# EAGLE design WEMOS_ESP32_2S_V5 (EAGLE 9.6.2)
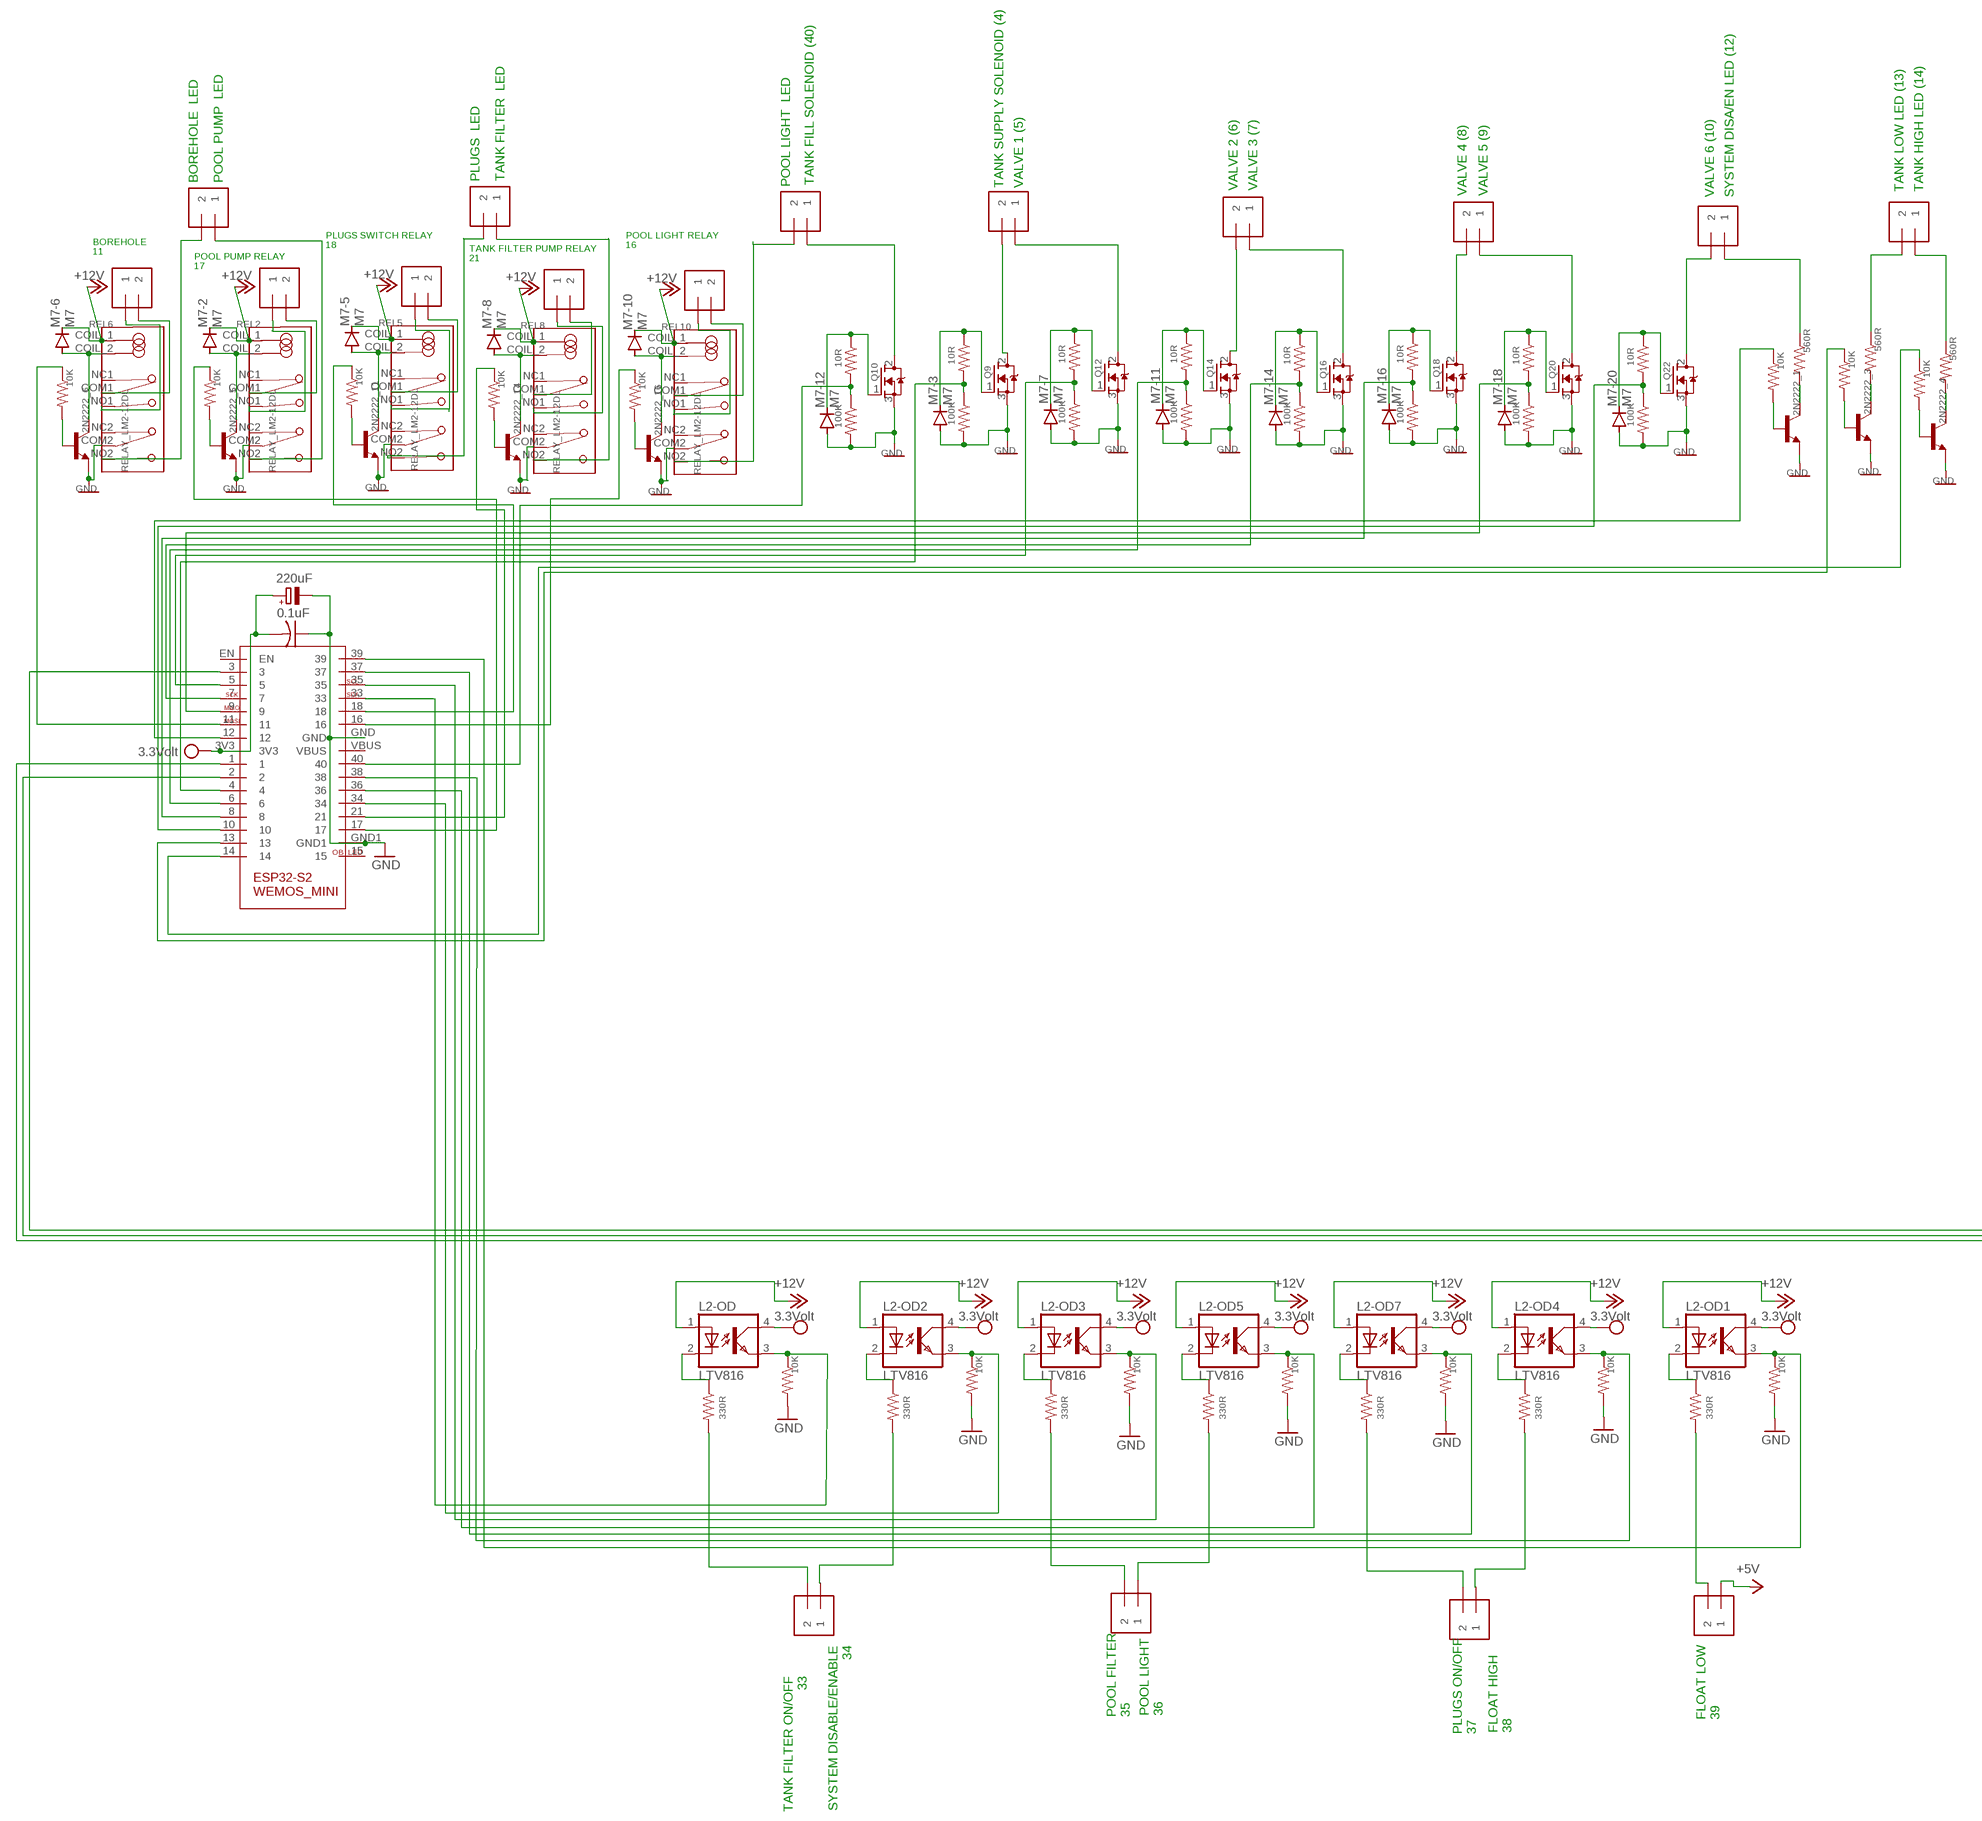
[diagram p0: schematic, sheet 1, part 1 of 2]
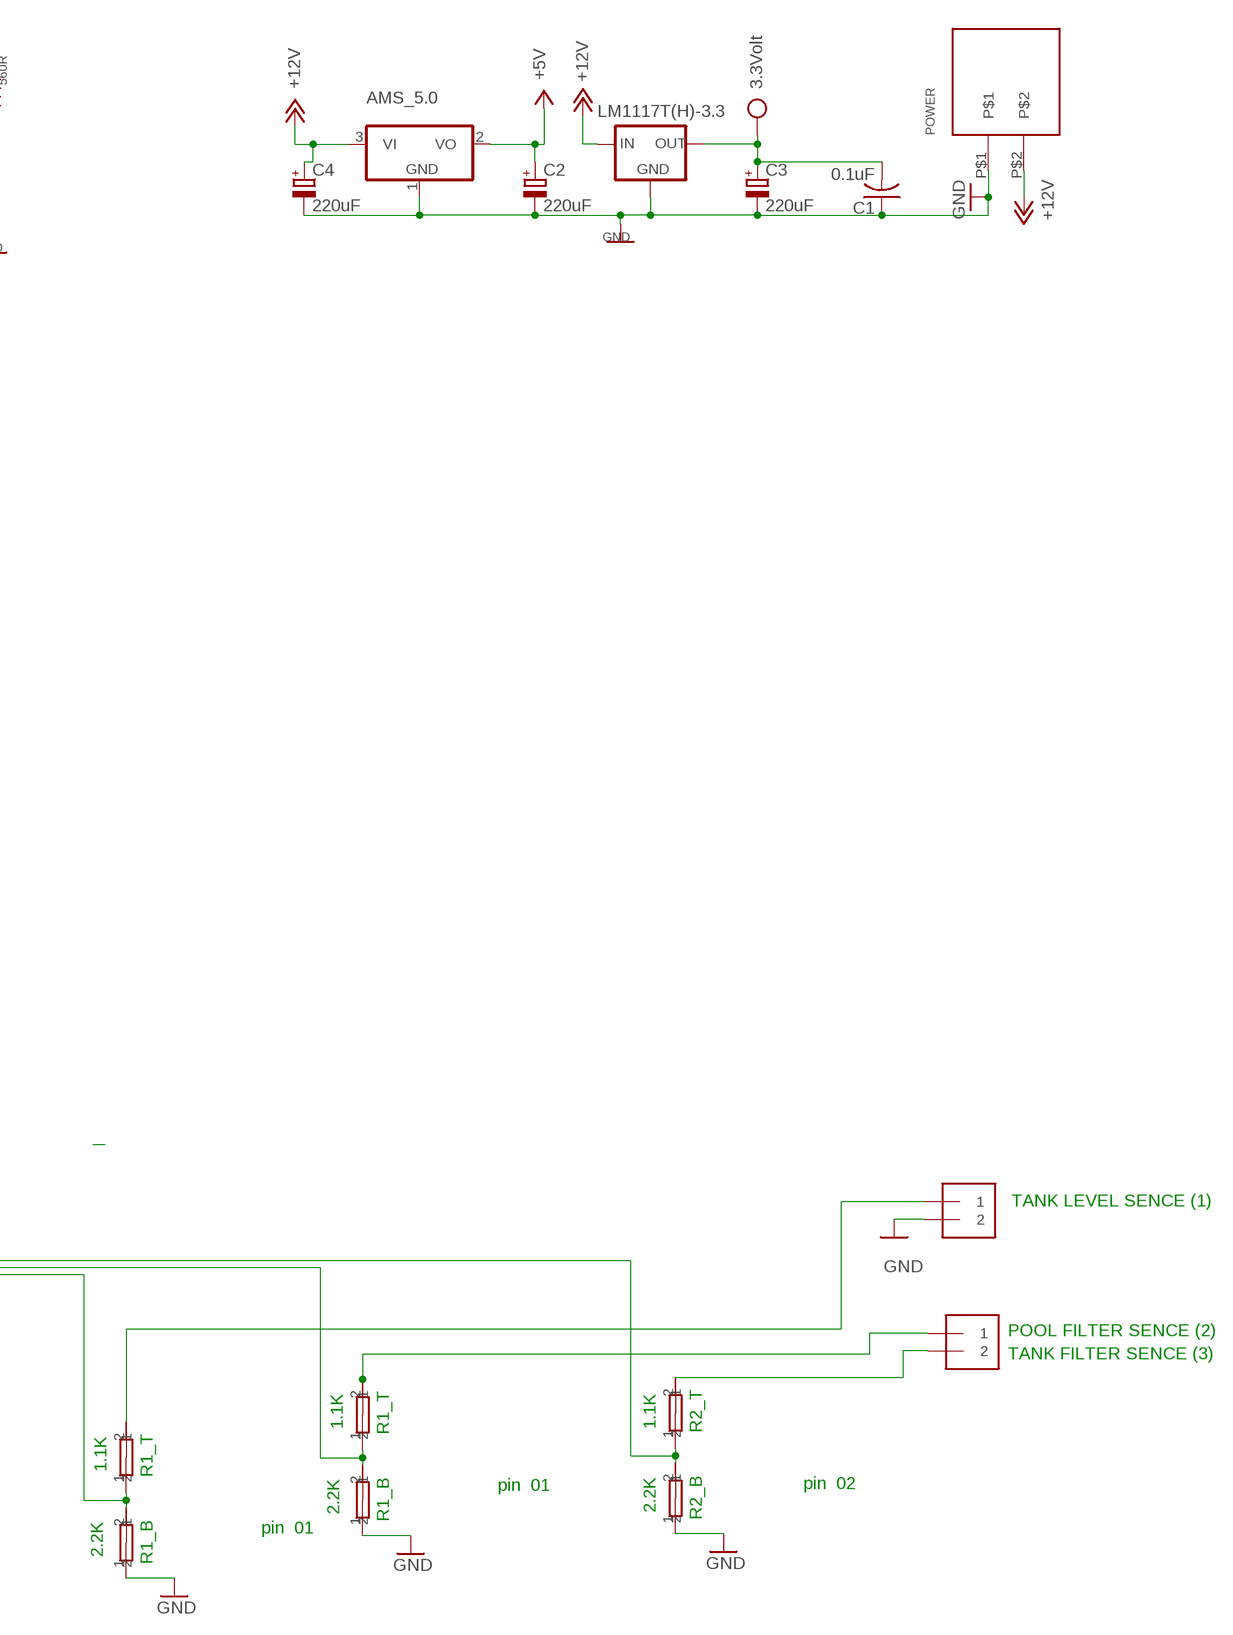
[diagram p1: schematic, sheet 1, part 2 of 2]

## Parts
2N2222_1  2N3904  [TO92]
2N2222_3  2N3904  [TO92]
2N2222_4  2N3904  [TO92]
2N2222_5  2N3904  [TO92]
2N2222_6  2N3904  [TO92]
2N2222_11  2N3904  [TO92]
2N2222_14  2N3904  [TO92]
2N2222_16  2N3904  [TO92]
12__1  FLOAT  TERMINNAL-3.5MM-2-3.5MMDOUBLE  [1X2-3.5MM]
12__2  FLOAT  TERMINNAL-3.5MM-2-3.5MMDOUBLE  [1X2-3.5MM]
12__3  FLOAT  TERMINNAL-3.5MM-2-3.5MMDOUBLE  [1X2-3.5MM]
12__4  FLOAT  TERMINNAL-3.5MM-2-3.5MMDOUBLE  [1X2-3.5MM]
12__5  FLOAT  TERMINNAL-3.5MM-2-3.5MMDOUBLE  [1X2-3.5MM]
12__6  FLOAT  TERMINNAL-3.5MM-2-3.5MMDOUBLE  [1X2-3.5MM]
12__7  FLOAT  TERMINNAL-3.5MM-2-3.5MMDOUBLE  [1X2-3.5MM]
12__13  FLOAT  TERMINNAL-3.5MM-2-3.5MMDOUBLE  [1X2-3.5MM]
18__1  FLOAT  TERMINNAL-3.5MM-2-3.5MMDOUBLE  [1X2-3.5MM]
18__2  FLOAT  TERMINNAL-3.5MM-2-3.5MMDOUBLE  [1X2-3.5MM]
+_33  AAA  TERMINNAL-3.5MM-2-3.5MMDOUBLE  [1X2-3.5MM]
+_35  TERMINNAL-3.5MM-2-3.5MMDOUBLE  [1X2-3.5MM]
+_37  TERMINNAL-3.5MM-2-3.5MMDOUBLE  [1X2-3.5MM]
+_39  TERMINNAL-3.5MM-2-3.5MMDOUBLE  [1X2-3.5MM]
AMS_5.0  AMS1117DB  [SOT223]
C1  0.1uF  C-US050-025X075  [C050-025X075]
C2  220uF  CPOL-EUE2.5-7  [E2,5-7]
C3  220uF  CPOL-EUE2.5-7  [E2,5-7]
C4  220uF  CPOL-EUE2.5-7  [E2,5-7]
C5  0.1uF  C-US050-025X075  [C050-025X075]
C6  220uF  CPOL-EUE2.5-7  [E2,5-7]
IC1  LM1117T(H)-3.3  [TO220H]
L2-OD  LTV816  [DIL04]
L2-OD1  LTV816  [DIL04]
L2-OD2  LTV816  [DIL04]
L2-OD3  LTV816  [DIL04]
L2-OD4  LTV816  [DIL04]
L2-OD5  LTV816  [DIL04]
L2-OD7  LTV816  [DIL04]
M7-2  M7  DIODE-SOD106-R  [SOD106-R]
M7-3  M7  DIODE-SOD106-R  [SOD106-R]
M7-5  M7  DIODE-SOD106-R  [SOD106-R]
M7-6  M7  DIODE-SOD106-R  [SOD106-R]
M7-7  M7  DIODE-SOD106-R  [SOD106-R]
M7-8  M7  DIODE-SOD106-R  [SOD106-R]
M7-10  M7  DIODE-SOD106-R  [SOD106-R]
M7-11  M7  DIODE-SOD106-R  [SOD106-R]
M7-12  M7  DIODE-SOD106-R  [SOD106-R]
M7-14  M7  DIODE-SOD106-R  [SOD106-R]
M7-16  M7  DIODE-SOD106-R  [SOD106-R]
M7-18  M7  DIODE-SOD106-R  [SOD106-R]
M7-20  M7  DIODE-SOD106-R  [SOD106-R]
POWER  TERMINAL-5.08MM-2BIG_HOLE  [TERM-5.05-2_BH]
Q9  IRF3205  MOSFET-NGDS_TO220V  [TO220V]
Q10  IRF3205  MOSFET-NGDS_TO220V  [TO220V]
Q12  IRF3205  MOSFET-NGDS_TO220V  [TO220V]
Q14  IRF3205  MOSFET-NGDS_TO220V  [TO220V]
Q16  IRF3205  MOSFET-NGDS_TO220V  [TO220V]
Q18  IRF3205  MOSFET-NGDS_TO220V  [TO220V]
Q20  IRF3205  MOSFET-NGDS_TO220V  [TO220V]
Q22  IRF3205  MOSFET-NGDS_TO220V  [TO220V]
R1  10K  R-US_R0805  [R0805]
R1_B  2.2K  RESISTOR  [0207/10]
R1_B1  2.2k  RESISTOR  [0207/10]
R1_B2  2.2K  RESISTOR  [0207/10]
R1_T  1.1K  RESISTOR  [0207/10]
R1_T1  1.1K  RESISTOR  [0207/10]
R2_T1  1.1K  RESISTOR  [0207/10]
R3  330R  R-US_R0805  [R0805]
R4  560R  R-US_R0805  [R0805]
R5  10K  R-US_R0805  [R0805]
R7  10K  R-US_R0805  [R0805]
R8  10R  R-US_R0805  [R0805]
R9  10K  R-US_R0805  [R0805]
R10  10K  R-US_R0805  [R0805]
R11  100K  R-US_R0805  [R0805]
R12  330R  R-US_R0805  [R0805]
R13  10K  R-US_R0805  [R0805]
R14  330R  R-US_R0805  [R0805]
R15  10K  R-US_R0805  [R0805]
R16  330R  R-US_R0805  [R0805]
R17  10K  R-US_R0805  [R0805]
R18  330R  R-US_R0805  [R0805]
R19  10K  R-US_R0805  [R0805]
R20  10K  R-US_R0805  [R0805]
R21  10K  R-US_R0805  [R0805]
R22  330R  R-US_R0805  [R0805]
R23  10K  R-US_R0805  [R0805]
R24  10K  R-US_R0805  [R0805]
R25  560R  R-US_R0805  [R0805]
R26  10R  R-US_R0805  [R0805]
R27  100K  R-US_R0805  [R0805]
R28  10K  R-US_R0805  [R0805]
R29  330R  R-US_R0805  [R0805]
R30  10K  R-US_R0805  [R0805]
R31  560R  R-US_R0805  [R0805]
R32  10R  R-US_R0805  [R0805]
R33  100K  R-US_R0805  [R0805]
R36  10R  R-US_R0805  [R0805]
R37  100K  R-US_R0805  [R0805]
R40  10R  R-US_R0805  [R0805]
R41  100K  R-US_R0805  [R0805]
R43  10R  R-US_R0805  [R0805]
R45  10R  R-US_R0805  [R0805]
R46  100K  R-US_R0805  [R0805]
R47  100K  R-US_R0805  [R0805]
R50  10R  R-US_R0805  [R0805]
R51  100K  R-US_R0805  [R0805]
REL2  RELAY_LM2-12DL  [RELAY4078]
REL5  RELAY_LM2-12DL  [RELAY4078]
REL6  RELAY_LM2-12DL  [RELAY4078]
REL8  RELAY_LM2-12DL  [RELAY4078]
REL10  RELAY_LM2-12DL  [RELAY4078]
U$1  WEMOS_S2_MINI  [WEMOS_S2_MINI]
XX1  FLOAT  TERMINNAL-3.5MM-2-3.5MMDOUBLE  [1X2-3.5MM]
XX3  FLOAT  TERMINNAL-3.5MM-2-3.5MMDOUBLE  [1X2-3.5MM]
XX6  FLOAT  TERMINNAL-3.5MM-2-3.5MMDOUBLE  [1X2-3.5MM]
XX8  FLOAT  TERMINNAL-3.5MM-2-3.5MMDOUBLE  [1X2-3.5MM]
XX10  FLOAT  TERMINNAL-3.5MM-2-3.5MMDOUBLE  [1X2-3.5MM]

## Nets
+5V [12V]: +_39.1 AMS_5.0.2(VO) C2.+
+12V [12V]: AMS_5.0.3(VI) C4.+ IC1.3(IN) L2-OD1.1(A) L2-OD2.1(A) L2-OD3.1(A) L2-OD4.1(A) L2-OD5.1(A) L2-OD7.1(A) L2-OD.1(A) M7-2.C M7-5.C M7-6.C M7-8.C M7-10.C POWER.P$2 REL2.COIL_1(COIL1) REL5.COIL_1(COIL1) REL6.COIL_1(COIL1) REL8.COIL_1(COIL1) REL10.COIL_1(COIL1)
GND [GND]: 2N2222_1.3(E) 2N2222_3.3(E) 2N2222_4.3(E) 2N2222_5.3(E) 2N2222_6.3(E) 2N2222_11.3(E) 2N2222_14.3(E) 2N2222_16.3(E) 18__1.2 AMS_5.0.1(GND) C1.1 C2.- C3.- C4.- C5.1 C6.- IC1.1(GND) M7-3.A M7-7.A M7-11.A M7-12.A M7-14.A M7-16.A M7-18.A M7-20.A POWER.P$1 Q9.3(S) Q10.3(S) Q12.3(S) Q14.3(S) Q16.3(S) Q18.3(S) Q20.3(S) Q22.3(S) R1_B1.1 R1_B2.1 R1_B.1 R7.2 R11.2 R13.2 R15.2 R17.2 R19.2 R23.2 R27.2 R30.2 R33.2 R37.2 R41.2 R46.2 R47.2 R51.2 REL2.COM2 REL5.COM2 REL6.COM2 REL8.COM2 REL10.COM2 U$1.GND U$1.GND1
N$1: R26.2 R27.1 U$1.5
N$2: 2N2222_6.2(B) R10.2
N$3: +_33.2 R3.2
N$4: R24.1 U$1.16
N$5: L2-OD.2(C) R3.1
N$6: R43.2 R46.1 U$1.40
N$7: 12__13.2 REL6.NO2
N$8: R5.1 U$1.17
N$9: M7-3.C Q9.1(G) R8.1
N$10: R1_B1.2 R2_T1.1 U$1.3
N$11: R8.2 R11.1 U$1.4
N$12: 2N2222_3.2(B) R21.2
N$13: 2N2222_5.1(C) M7-2.A REL2.COIL_2(COIL2)
N$14: 2N2222_1.1(C) R4.2
N$15: 2N2222_5.2(B) R5.2
N$16 [POWER]: REL2.COM1 XX3.2
N$17: R9.1 U$1.18
N$18: R20.1 U$1.21
N$19 [POWER]: REL2.NO1 XX3.1
N$20: L2-OD1.2(C) R29.1
N$21: +_39.2 R29.2
N$22: 2N2222_3.1(C) R25.2
N$23: M7-7.C Q12.1(G) R26.1
N$24: R10.1 U$1.11
N$25: R1_B.2 R1_T.1 U$1.2
N$26: 12__13.1 REL2.NO2
N$27: R40.2 R41.1 U$1.8
N$28: +_33.1 R12.2
N$29: 2N2222_4.2(B) R28.2
N$30: R21.1 U$1.13
N$31: 2N2222_1.2(B) R1.2
N$32: 2N2222_4.1(C) R31.2
N$33: R28.1 U$1.14
N$34: R36.2 R37.1 U$1.7
N$35: L2-OD7.3(EMIT) R23.1 U$1.37
N$36: M7-11.C Q14.1(G) R32.1
N$37: R32.2 R33.1 U$1.6
N$38: 18__1.1 R1_T1.2
N$39: R1.1 U$1.12
N$40 [POWER]: REL5.COM1 XX6.2
N$41: L2-OD2.3(EMIT) R13.1 U$1.34
N$42: L2-OD.3(EMIT) R7.1 U$1.33
N$43: 18__2.2 R2_T1.2
N$44: M7-14.C Q16.1(G) R36.1
N$45 [POWER]: REL5.NO1 XX6.1
N$46: L2-OD1.3(EMIT) R30.1 U$1.39
N$47: L2-OD2.2(C) R12.1
N$48 [POWER]: REL8.COM1 XX8.2
N$49 [POWER]: REL8.NO1 XX8.1
N$50 [POWER]: REL10.COM1 XX10.2
N$51 [POWER]: REL10.NO1 XX10.1
N$52: M7-16.C Q18.1(G) R40.1
N$53 [POWER]: REL6.COM1 XX1.2
N$54 [POWER]: REL6.NO1 XX1.1
N$55: +_35.2 R14.2
N$56: L2-OD5.3(EMIT) R19.1 U$1.36
N$57: 18__2.1 R1_T.2
N$58: L2-OD3.2(C) R14.1
N$60: +_35.1 R18.2
N$61: L2-OD3.3(EMIT) R15.1 U$1.35
N$62: 2N2222_6.1(C) M7-6.A REL6.COIL_2(COIL2)
N$65: +_37.2 R22.2
N$67: M7-18.C Q20.1(G) R45.1
N$69: L2-OD4.2(C) R16.1
N$71: +_37.1 R16.2
N$72: L2-OD4.3(EMIT) R17.1 U$1.38
N$73: R45.2 R47.1 U$1.9
N$74: L2-OD5.2(C) R18.1
N$76: 2N2222_11.1(C) M7-5.A REL5.COIL_2(COIL2)
N$77: 2N2222_11.2(B) R9.2
N$78: M7-12.C Q10.1(G) R43.1
N$81: 12__1.2 REL5.NO2
N$84: L2-OD7.2(C) R22.1
N$85: M7-20.C Q22.1(G) R50.1
N$86: R50.2 R51.1 U$1.10
N$87: 12__1.1 REL8.NO2
N$91: 12__2.2 REL10.NO2
N$92: 2N2222_14.1(C) M7-8.A REL8.COIL_2(COIL2)
N$93: 2N2222_14.2(B) R20.2
N$96 [POWER]: 12__2.1 Q10.2(D)
N$97: R1_B2.2 R1_T1.1 U$1.1
N$100 [POWER]: 12__3.2 Q9.2(D)
N$101 [POWER]: 12__3.1 Q12.2(D)
N$102 [POWER]: 12__4.2 Q14.2(D)
N$103: 2N2222_16.1(C) M7-10.A REL10.COIL_2(COIL2)
N$104: 2N2222_16.2(B) R24.2
N$107 [POWER]: 12__4.1 Q16.2(D)
N$108 [POWER]: 12__5.2 Q18.2(D)
N$109 [POWER]: 12__5.1 Q20.2(D)
N$110 [POWER]: 12__6.2 Q22.2(D)
N$111: 12__6.1 R4.1
N$112: 12__7.2 R25.1
N$113: 12__7.1 R31.1
VCC [3V]: C1.2 C3.+ C5.2 C6.+ IC1.2(OUT) L2-OD1.4(COL) L2-OD2.4(COL) L2-OD3.4(COL) L2-OD4.4(COL) L2-OD5.4(COL) L2-OD7.4(COL) L2-OD.4(COL) U$1.3V3
Unconnected: REL2.NC1 REL2.NC2 REL5.NC1 REL5.NC2 REL6.NC1 REL6.NC2 REL8.NC1 REL8.NC2 REL10.NC1 REL10.NC2 U$1.15 U$1.EN U$1.VBUS

## Notes on the sheet
- BOREHOLE  LED | POOL PUMP  LED | PLUGS  LED | TANK FILTER  LED
- POOL LIGHT  LED | TANK FILL SOLENOID (40) | TANK SUPPLY SOLENOID (4) | VALVE 1 (5)
- VALVE 2 (6) | VALVE 3 (7) | TANK LOW LED (13) | TANK HIGH LED (14)
- VALVE 4 (8) | VALVE 5 (9) | VALVE 6 (10) | SYSTEM DISA/EN LED (12)
- PLUGS SWITCH RELAY
  18
- POOL LIGHT RELAY
  16
- BOREHOLE
  11
- TANK FILTER PUMP RELAY
  21
- POOL PUMP RELAY
  17
- TANK LEVEL SENCE (1)
- POOL FILTER SENCE (2)
- TANK FILTER SENCE (3)
- 1.1K | 1.1K | R2_T
- R1_T
- 1.1K
- R1_T
- pin  01 | pin  02
- 2.2K | 2.2K
- R1_B | R2_B
- pin  01
- 2.2K
- R1_B
- SYSTEM DISABLE/ENABLE
  34
- TANK FILTER ON/OFF
  33
- POOL LIGHT
  36
- POOL FILTER
  35
- FLOAT LOW
  39
- FLOAT HIGH
  38
- PLUGS ON/OFF
  37

## Library data of the parts
2N2222_1 2N2222_3-2N2222_6 2N2222_11 2N2222_14 2N2222_16 = transistor:2N3904: NPN TRANSISTOR
12__1-12__7 12__13 18__1 18__2 +_33 +_35 +_37 +_39 XX1 XX3 XX6 XX8 XX10 = BDV_02:TERMINNAL-3.5MM-2: 3.5mm Terminal block http://www.ladyada.net/library/pcb/eaglelibrary.html
AMS_5.0 = BDV_01:AMS1117: 250 mA, 16V, Low Quiescent Current LDO Regulator Source: http://ww1.microchip.com/downloads/en/DeviceDoc/22049b.pdf
C1 C5 = adafruit:C-US: CAPACITOR, American symbol
C2-C4 C6 = resistor:CPOL-EU: POLARIZED CAPACITOR, European symbol
IC1 = lm1117_10:LM1117?-*: 800mA Low-Dropout Linear Regulator Source: http://www.ti.com/lit/ds/symlink/lm1117-n.pdf; MF: Texas Instruments; MPN: LM1117T-3.3; OC_FARNELL: 1469056; OC_NEWARK: 13B5347
L2-OD L2-OD1-L2-OD5 L2-OD7 = optocoupler:LTV816: OPTO COUPLER Source: LITEON, LTV816.pdf; OC_FARNELL: unknown; OC_NEWARK: unknown
M7-2 M7-3 M7-5-M7-8 M7-10-M7-12 M7-14 M7-16 M7-18 M7-20 = diode:DIODE-: DIODE
POWER = BDV_02:TERMINAL-5.08MM-2: Terminal 5.08mm - 2
Q9 Q10 Q12 Q14 Q16 Q18 Q20 Q22 = adafruit:MOSFET-N: N-Channel Mosfet 2N7002E - 60V 260mA SOT23 [Digikey: 2N7002ET1GOSTR-ND] - REEL BSH103 - 30V 850mA SOT23 [Digikey: 568-5013-1-ND]
R1 R3-R5 R7-R33 R36 R37 R40 R41 R43 R45-R47 R50 R51 = resistor:R-US_: RESISTOR, American symbol
R1_B R1_B1 R1_B2 R1_T R1_T1 R2_T1 = BDV_02:RESISTOR
REL2 REL5 REL6 REL8 REL10 = BDV_02:RELAY_LM2-12DL: Relay Small Symbol
U$1 = BDV_02:WEMOS_S2_MINI: WEMOS_MINI

## Net classes
0 default: width 0.305 mm, drill 0.305 mm, clearance 0.305 mm
1 POWER: width 0.889 mm, drill 0.508 mm, clearance 0.305 mm to class 0, clearance 0.508 mm
2 12V: width 0.889 mm, drill 0.508 mm, clearance 0.305 mm to class 0, clearance 0.508 mm
3 ground: width 0.889 mm, drill 0.508 mm, clearance 0.305 mm to class 0, clearance 0.305 mm to class 1, clearance 0.305 mm to class 2, clearance 0.305 mm
4 3V: width 0.635 mm, drill 0.508 mm, clearance 0.305 mm to class 0, clearance 0.508 mm
5 GND: width 0.889 mm, drill 0.508 mm, clearance 0.305 mm to class 0, clearance 0.508 mm

## Board
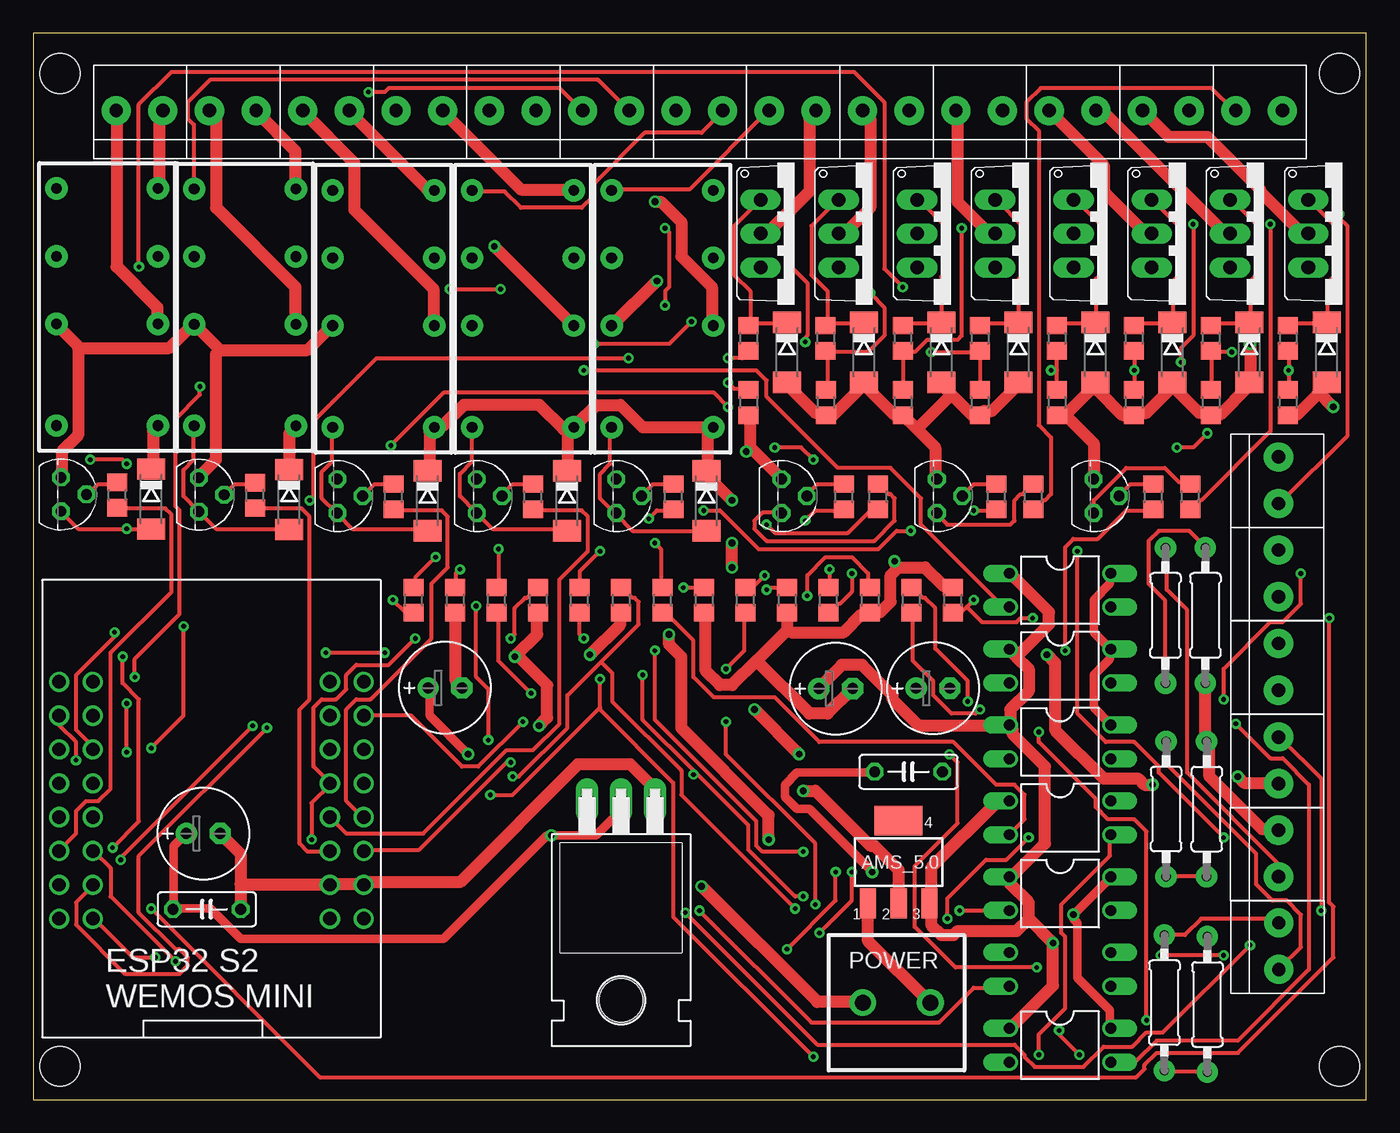
[diagram p2: board, top side]
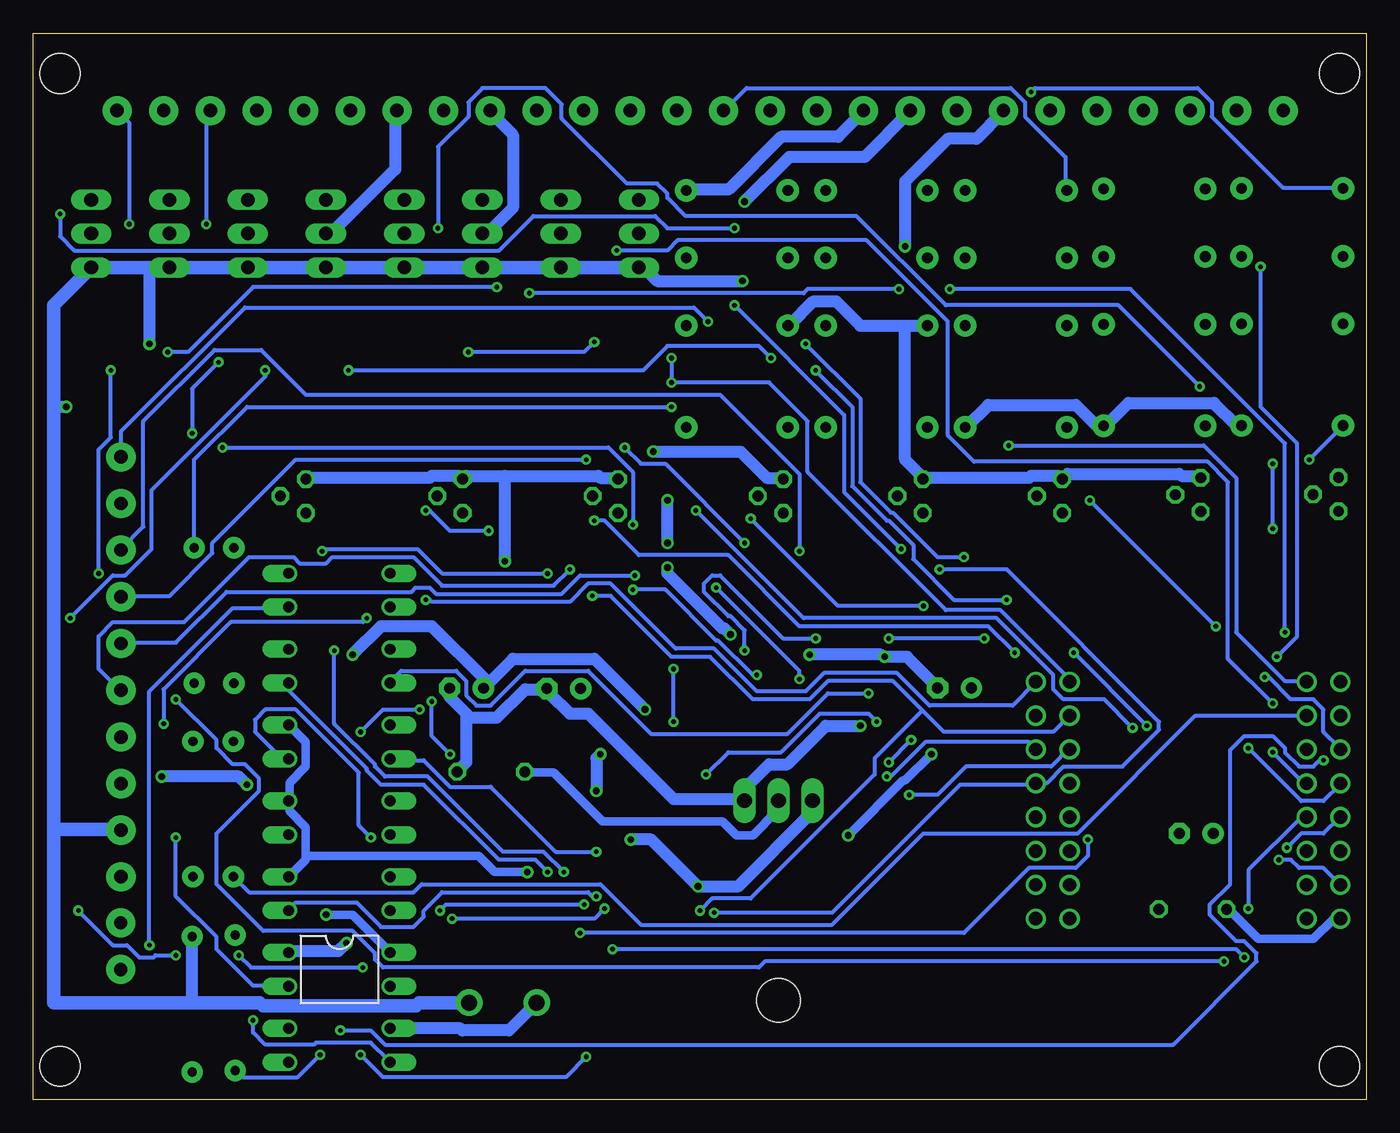
[diagram p3: board, bottom side, seen from below]

Size 100 x 80 mm. Coordinates in mm from the lower left corner, seen from the top.
Outline: 0,0 100,0 100,80 0,80 0,0
Copper layers (1*16): Top 0.035mm / dielectric 1.5mm / Bottom 0.035mm
Design rules "default *": minimum track width 6mil, minimum drill 0.35mm, track to track 6mil, track to pad 6mil, pad to pad 6mil, via to via 6mil, smd to smd 6mil, copper to edge 40mil, drill to drill 6mil, minimum pad ring 10mil, minimum via ring 8mil, stop-mask expansion 4mil, vias tented up to drill 20mil, thermal gap 10mil
Holes 3 mm at 2,77 2,2.5 98,2.5 98,77

### Footprints (pad centres in the part's own frame; a part is rotated, then mirrored left to right if it is on the bottom)
TO92 = drill 0.813 octagon: 1 1.27,0; 2 0,1.905; 3 -1.27,0
1X2-3.5MM = drill 1 pad 2.184: 1 1.8,0; 2 -1.7,0
SOT223 = smd 1.219 x 2.235: 1 -2.311,-3.099; 2 0,-3.099; 3 2.311,-3.099 | smd 3.6 x 2.2: 4 0,3.099
C050-025X075 = drill 0.813 octagon: 1 -2.54,0; 2 2.54,0
E2,5-7 = drill 0.813 pad 1.6: + -1.27,0 | drill 0.813 pad 1.6 octagon: - 1.27,0
TO220H = drill 1.118 long: 1 -2.54,-10.16; 2 0,-10.16; 3 2.54,-10.16 | hole 3.302: 0,4.826
DIL04 = drill 0.813 offset: 1 -1.27,-3.81; 2 1.27,-3.81; 3 1.27,3.81; 4 -1.27,3.81
SOD106-R = smd 1.6 x 2.1: A 2.25,0; C -2.25,0
TERM-5.05-2_BH = drill 1.2 pad 2: P$1 0,2.54; P$2 0,-2.54
TO220V = drill 1.016 long: 1 -2.54,-2.54; 2 0,-2.54; 3 2.54,-2.54
R0805 = smd 1.3 x 1.5: 1 -0.95,0; 2 0.95,0
0207/10 = drill 0.7 pad 1.6: 1 -5.08,0; 2 5.08,0
RELAY4078 = drill 0.8 pad 1.676: COIL_1 -3.81,8.89; COIL_2 3.81,8.89; COM1 -3.81,1.27; COM2 3.81,1.27; NC1 -3.81,-3.81; NC2 3.81,-3.81; NO1 -3.81,-8.89; NO2 3.81,-8.89
WEMOS_S2_MINI = drill 1: 1 -8.89,10.16; 2 -8.89,7.62; 3 -11.43,7.62; 3V3 -11.43,-7.62; 4 -8.89,5.08; 5 -11.43,5.08; 6 -8.89,2.54; 7 -11.43,2.54; 8 -8.89,0; 9 -11.43,0; 10 -8.89,-2.54; 11 -11.43,-2.54; 12 -11.43,-5.08; 13 -8.89,-5.08; 14 -8.89,-7.62; 15 8.89,-7.62; 16 11.43,-2.54; 17 8.89,-2.54; 18 11.43,0; 21 8.89,0; 33 11.43,2.54; 34 8.89,2.54; 35 11.43,5.08; 36 8.89,5.08; 37 11.43,7.62; 38 8.89,7.62; 39 11.43,10.16; 40 8.89,10.16; EN -11.43,10.16; GND 11.43,-5.08; GND1 8.89,-5.08; VBUS 11.43,-7.62

### Placement (x,y rotation side)
2N2222_1  56.13,45.28 270 top
2N2222_3  67.79,45.28 270 top
2N2222_4  79.55,45.28 270 top
2N2222_5  12.41,45.38 270 top
2N2222_6  2.08,45.41 270 top
2N2222_11  22.8,45.28 270 top
2N2222_14  33.27,45.28 270 top
2N2222_16  43.73,45.28 270 top
12__1  49.91,74.2 0 top
12__2  56.91,74.2 0 top
12__3  63.91,74.2 0 top
12__4  70.91,74.2 0 top
12__5  77.91,74.2 0 top
12__6  84.91,74.2 0 top
12__7  91.91,74.2 0 top
12__13  42.91,74.2 0 top
18__1  93.42,18.52 270 top
18__2  93.45,11.56 270 top
+_33  93.43,46.52 270 top
+_35  93.43,39.53 270 top
+_37  93.43,32.51 270 top
+_39  93.43,25.5 270 top
AMS_5.0  64.92,17.82 0 top
C1  65.66,24.59 180 top
C2  67.5,30.86 0 top
C3  30.89,30.89 0 top
C4  60.2,30.84 0 top
C5  13.02,14.27 180 top
C6  12.75,19.96 0 top
IC1  44.09,12.27 180 top
L2-OD  77.03,38.21 270 top
L2-OD1  77.03,4.06 270 top
L2-OD2  77.03,32.52 270 top
L2-OD3  77.03,26.83 270 top
L2-OD4  77.03,9.76 270 bottom
L2-OD5  77.03,21.14 270 top
L2-OD7  77.03,15.45 270 top
M7-2  19.18,45.02 270 top
M7-3  62.34,56.07 270 top
M7-5  29.57,44.92 270 top
M7-6  8.84,45.05 270 top
M7-7  68.12,56.07 270 top
M7-8  40.03,44.92 270 top
M7-10  50.5,44.92 270 top
M7-11  73.9,56.07 270 top
M7-12  56.55,56.07 270 top
M7-14  79.68,56.07 270 top
M7-16  85.46,56.07 270 top
M7-18  91.25,56.07 270 top
M7-20  97.03,56.07 270 top
POWER  64.77,7.26 270 top
Q9  62.97,64.97 270 top
Q10  57.1,64.97 270 top
Q12  68.84,64.97 270 top
Q14  74.71,64.97 270 top
Q16  80.58,64.97 270 top
Q18  86.45,64.97 270 top
Q20  92.33,64.97 270 top
Q22  98.2,64.97 270 top
R1  60.81,45.23 90 top
R1_B  88.04,21.79 270 top
R1_B1  88.09,7.14 270 top
R1_B2  87.93,36.32 90 top
R1_T  84.99,21.79 90 top
R1_T1  84.94,36.32 90 top
R2_T1  84.86,7.26 90 top
R3  28.55,37.46 90 top
R4  63.37,45.23 90 top
R5  16.64,45.33 90 top
R7  31.66,37.46 270 top
R8  59.44,57.12 270 top
R9  27.03,45.23 90 top
R10  6.3,45.35 90 top
R11  59.45,52.3 270 top
R12  34.77,37.46 90 top
R13  37.88,37.46 270 top
R14  40.99,37.46 90 top
R15  44.11,37.46 270 top
R16  59.67,37.46 90 top
R17  62.78,37.46 270 top
R18  47.22,37.46 90 top
R19  50.33,37.46 270 top
R20  37.49,45.23 90 top
R21  72.26,45.23 90 top
R22  53.44,37.46 90 top
R23  56.55,37.46 270 top
R24  48.03,45.23 90 top
R25  75.03,45.23 90 top
R26  65.23,57.12 270 top
R27  65.23,52.3 270 top
R28  84.02,45.23 90 top
R29  65.89,37.46 90 top
R30  69,37.46 90 top
R31  86.79,45.23 90 top
R32  71.01,57.12 270 top
R33  71.01,52.3 270 top
R36  76.79,57.12 270 top
R37  76.79,52.3 270 top
R40  82.57,57.12 270 top
R41  82.57,52.3 270 top
R43  53.66,57.12 270 top
R45  88.35,57.12 270 top
R46  53.67,52.3 270 top
R47  88.35,52.3 270 top
R50  94.14,57.12 270 top
R51  94.13,52.3 270 top
REL2  15.88,59.44 180 top
REL5  26.27,59.33 180 top
REL6  5.54,59.46 180 top
REL8  36.73,59.33 180 top
REL10  47.2,59.33 180 top
U$1  13.36,21.18 0 top
XX1  7.91,74.2 0 top
XX3  14.91,74.2 0 top
XX6  21.91,74.2 0 top
XX8  28.91,74.2 0 top
XX10  35.91,74.2 0 top

### Tracks (layer width: path | path; a pad name or v marks a point on that pad's centre or on a via)
+5V  (via drill 0.51)
  Top 0.889: AMS_5.0.2 64.92,17.22 63.09,19.05 62.79,19.05 58.67,23.16 v57.76,23.16 | v54.1,29.26 v57.45,25.91 | v90.37,24.23 90.83,23.77 93.42,23.77 +_39.1 | v83.97,23.62 83.36,23.62 82.91,24.08 80.31,24.08 76.66,27.74 76.66,32.77 v76.05,33.38
  Bottom 0.889: v57.76,23.16 57.76,25.6 v57.45,25.91 | v54.1,29.26 57.91,33.07 64.01,33.07 66.14,30.94 C2.+ 66.14,31.55 70.1,35.51 73.91,35.51 v76.05,33.38 | v90.37,24.23 84.58,24.23 v83.97,23.62
+12V  (via drill 0.51)
  Top 0.889: M7-6.C 8.99,47.4 8.99,50.14 9.3,50.44 REL6.COIL_1 | M7-2.C 19.2,47.4 19.2,49.99 19.66,50.44 REL2.COIL_1 | M7-5.C 29.72,47.24 29.72,50.14 30.02,50.44 REL5.COIL_1 30.48,50.6 30.79,50.6 32.31,52.12 37.95,52.12 39.78,50.29 REL8.COIL_1 | M7-8.C 40.08,47.24 40.08,49.99 REL8.COIL_1 | REL8.COIL_1 40.84,50.75 42.22,52.12 44.04,52.12 45.72,50.44 REL10.COIL_1 50.9,50.44 50.6,50.14 50.6,47.24 M7-10.C 50.6,46.79 v52.43,44.96 | 73.76,33.22 73.3,33.68 L2-OD2.1 | 73.76,33.22 74.68,32.31 74.68,30.63 73.3,29.26 73.3,28.19 L2-OD3.1 | 73.76,33.22 76.2,35.66 76.2,36.58 73.3,39.47 L2-OD.1 | C4.+ 58.98,30.94 60.66,32.61 62.18,32.61 64.47,30.33 64.47,30.02 66.45,28.04 72.85,28.04 L2-OD3.1 | L2-OD5.1 73.15,22.4 72.39,22.4 67.36,17.37 67.36,14.78 AMS_5.0.3 67.36,14.33 67.36,13.11 68.12,12.34 69.04,12.34 69.34,12.65 73.76,12.65 74.68,13.56 | 74.68,13.56 74.68,14.78 73.3,16.15 73.3,16.61 L2-OD7.1 73.61,16.92 75.89,19.2 75.89,24.99 73.46,27.43 73.46,27.74 L2-OD3.1 | 74.68,13.56 v76.5,11.73 76.5,8.53 73.3,5.33 L2-OD1.1 | v50.14,16 58.83,7.32 62.18,7.32 POWER.P$2 | v52.43,39.93 v52.43,41.76 | v47.7,34.9 47.7,34.14 48.62,33.22 48.62,27.89 55.17,21.34 v55.17,19.51
  Bottom 0.889: REL5.COIL_1 30.02,50.44 28.35,52.12 21.79,52.12 20.27,50.6 19.81,50.6 REL2.COIL_1 19.36,50.75 17.83,52.27 11.43,52.27 9.75,50.6 9.45,50.6 REL6.COIL_1 | v76.5,11.73 77.11,11.12 80.77,11.12 L2-OD4.1 | L2-OD1.1 67.97,5.33 67.82,5.18 64.31,5.18 POWER.P$2 | IC1.3 41.6,22.4 41.6,21.49 47.09,16 v50.14,16 53.65,19.51 v55.17,19.51 | v52.43,41.76 v52.43,44.96 | v52.43,39.93 52.43,39.47 48.31,35.36 48.16,35.36 v47.7,34.9
GND  (via drill 0.51)
  Top 0.889: 77.42,51.36 76.81,51.36 R37.2 | 77.42,51.36 79.55,53.49 79.55,53.8 M7-14.A 79.86,53.19 81.69,51.36 82.45,51.36 R41.2 82.91,51.51 83.52,51.51 85.19,53.19 M7-16.A 85.5,53.8 85.5,53.49 87.48,51.51 87.94,51.51 R47.2 88.39,51.36 89,51.36 91.14,53.49 91.14,53.8 M7-18.A 91.29,54.25 v91.29,56.69 | 2N2222_4.3 79.55,49.23 77.42,51.36 | 53.8,48.92 53.8,51.21 R46.2 | 53.8,48.92 56.08,46.63 2N2222_1.3 | v53.49,48.62 53.8,48.92 | 68.89,52.88 67.97,53.8 M7-7.A | 68.89,52.88 70.41,51.36 70.87,51.36 R33.2 71.32,51.66 71.93,51.66 73.76,53.49 73.76,53.8 M7-11.A | M7-12.A 56.69,53.8 56.69,53.49 58.67,51.51 59.13,51.51 R11.2 59.59,51.36 60.05,51.36 62.48,53.8 M7-3.A 62.64,53.34 64.62,51.36 R27.2 65.53,51.05 66.29,50.29 | 66.29,50.29 67.67,48.92 67.67,46.63 2N2222_3.3 | 66.29,50.29 68.89,52.88 | 56.54,35.2 54.25,32.92 | 54.25,32.92 52.43,31.09 51.51,31.09 50.44,32.16 50.44,36.42 R19.2 | 56.54,35.2 56.54,36.42 R23.2 | 56.54,35.2 56.84,35.05 60.81,35.05 62.18,36.42 62.64,36.42 R17.2 63.25,36.58 63.55,36.58 64.31,37.34 64.31,39.32 64.92,39.93 | 64.92,39.93 66.9,39.93 68.28,38.56 68.89,38.56 R30.2 | 15.54,16.15 15.54,18.44 C6.- | 15.54,16.15 15.54,14.33 C5.1 | 15.54,16.15 21.95,16.15 U$1.GND1 22.25,16.15 24.69,16.15 U$1.GND 25.15,16.31 32,16.31 40.84,25.15 44.81,25.15 46.63,23.32 IC1.1 | R7.2 31.7,36.42 31.7,31.39 32.16,30.94 C3.- | v36.12,33.22 36.27,33.38 | 36.27,33.38 37.8,34.9 37.8,36.42 R13.2 | v41.76,33.38 44.04,35.66 44.04,36.42 R15.2 | 36.27,33.38 38.56,31.09 38.56,28.65 v37.95,28.04 | 54.25,32.92 58.22,28.96 59.59,28.96 61.42,30.79 C4.- | v64.62,40.39 64.62,40.23 64.92,39.93
  Top 0.889: 14.02,56.24 20.57,56.24 22.4,58.06 REL5.COM2 | 14.02,56.24 12.19,58.06 REL2.COM2 11.73,57.91 10.21,56.39 3.35,56.39 | 3.35,56.39 3.35,56.54 1.83,58.06 REL6.COM2 | 3.35,56.39 3.35,49.84 2.13,48.62 2.13,46.79 2N2222_6.3 | 14.02,56.24 13.72,55.93 13.72,48.01 12.5,46.79 2N2222_5.3 | R1_B2.1 87.94,26.98 R1_B.1 88.24,26.52 88.24,24.23 92.2,20.27 93.42,20.27 18__1.2 | 96.47,53.03 96.93,53.49 96.93,53.8 M7-20.A | 96.47,53.03 94.79,51.36 94.18,51.36 R51.2 | AMS_5.0.1 62.64,14.63 62.64,11.89 67.21,7.32 POWER.P$1 | v97.54,51.97 96.47,53.03 | v46.79,61.42 43.43,58.06 REL10.COM2
  Bottom 0.889: v53.49,48.62 46.94,48.62 44.96,46.63 43.74,46.63 2N2222_16.3 | 64.62,46.79 67.51,46.79 67.67,46.63 2N2222_3.3 68.12,46.79 70.1,46.79 70.26,46.63 79.55,46.63 2N2222_4.3 | 64.62,46.79 57.61,46.79 57.45,46.63 56.24,46.63 2N2222_1.3 | C3.- 32.16,30.94 34.44,33.22 v36.12,33.22 36.42,33.38 v41.76,33.38 | 67.51,28.65 67.51,28.96 68.73,30.18 68.73,30.79 C2.- | 67.51,28.65 67.51,25.3 68.12,24.69 C1.1 | 67.51,28.65 65.23,28.65 63.09,30.79 61.57,30.79 C4.- 61.27,30.48 59.74,28.96 58.37,28.96 51.97,22.55 46.63,22.55 IC1.1 46.33,22.86 46.33,23.62 44.81,25.15 43.43,25.15 40.54,28.04 v37.95,28.04 | v64.62,40.39 64.62,46.79 | 34.59,58.06 37.95,58.06 39.78,59.89 41.45,59.89 43.28,58.06 REL10.COM2 | 34.59,58.06 REL8.COM2 | 2N2222_5.3 12.5,46.79 13.87,46.79 14.02,46.94 22.4,46.94 22.71,46.63 2N2222_11.3 23.16,46.79 25.15,46.79 25.3,46.63 33.22,46.63 2N2222_14.3 33.53,46.94 34.59,48.01 34.59,58.06 | Q9.3 60.5,62.48 60.5,62.43 | Q12.3 66.45,62.48 66.45,62.43 | Q14.3 72.24,62.48 72.24,62.43 | Q16.3 78.18,62.48 78.18,62.43 | Q18.3 83.97,62.48 83.97,62.43 | Q20.3 89.92,62.48 89.92,62.43 | 88.09,7.26 R1_B1.1 | v97.54,51.97 98.48,51.97 | v46.79,61.42 53.19,61.42 54.1,62.33 Q10.3 | 91.29,62.43 v91.29,56.69
  Bottom 1: Q10.3 Q9.3 60.5,62.43 Q12.3 66.45,62.43 Q14.3 72.24,62.43 Q16.3 78.18,62.43 Q18.3 83.97,62.43 Q20.3 89.92,62.43 91.29,62.43 Q22.3 98.48,59.61 98.48,51.97 98.48,20.27 | 98.48,20.27 98.48,7.26 88.09,7.26 83.01,7.26 82.77,7.02 71.29,7.02 71.05,7.26 POWER.P$1 | 18__1.2 93.47,20.27 98.48,20.27
N$1  (via drill 0.35)
  Top 0.305: R27.1 65.23,53.34 65.23,56.08 R26.2 65.38,56.08 66.14,56.08 67.06,57 69.34,57 69.65,57.3 v69.65,65.38 | v12.5,53.49 12.5,52.88 10.67,51.05 10.67,44.5 10.97,44.2 10.97,36.42 7.62,33.07 v7.62,31.7
  Bottom 0.305: v69.65,65.38 69.65,71.48 67.36,73.76 67.36,74.83 66.29,75.89 61.57,75.89 60.35,74.68 60.35,73.61 55.47,68.73 53.19,68.73 52.43,67.97 52.43,67.67 51.05,66.29 38.25,66.29 31.55,59.59 18.59,59.59 v12.5,53.49 | v7.62,31.7 7.32,31.7 5.64,30.02 3.96,30.02 3.2,29.26 3.2,27.58 1.98,26.36 U$1.5
N$2
  Top 0.305: R10.2 6.25,46.18 4.88,46.18 4.12,45.41 2N2222_6.2
N$3  (via drill 0.35)
  Top 0.305: v30.18,40.69 28.65,39.17 28.65,38.56 R3.2 | v42.06,56.69 47.7,56.69 v49.38,58.37
  Bottom 0.305: v30.18,40.69 32.16,40.69 35.51,44.04 35.66,44.04 37.95,46.33 37.95,52.58 v42.06,56.69 | v49.38,58.37 50.44,59.44 84.12,59.44 93.42,50.14 93.42,48.31 +_33.2
N$4  (via drill 0.35)
  Top 0.305: v46.18,43.59 46.79,44.2 48.01,44.2 R24.1 | v33.22,37.03 33.22,31.7 34.14,30.79 v34.14,26.98 | v35.81,25.3 35.51,25.3 28.96,18.75 24.84,18.75 U$1.16
  Bottom 0.305: v46.18,43.59 39.62,37.03 v33.22,37.03 | v35.81,25.3 v34.14,26.98
N$5  (via drill 0.35)
  Top 0.305: v26.98,37.49 27.89,36.58 28.5,36.58 R3.1 | v41.3,54.71 54.25,54.71 55.02,53.95 55.02,52.73 60.35,47.4 64.31,47.4 66.6,45.11 66.6,43.13 72.69,37.03 73.15,37.03 L2-OD.2
  Bottom 0.305: v26.98,37.49 30.94,37.49 33.98,40.54 33.98,41.6 35.81,43.43 35.97,43.43 38.56,46.02 38.56,51.97 v41.3,54.71
N$6  (via drill 0.35)
  Top 0.305: v52.12,53.8 52.58,53.34 53.65,53.34 R46.1 | v52.12,55.63 53.19,55.63 53.65,56.08 R43.2
  Bottom 0.305: v52.12,55.63 v52.12,53.8 44.81,53.8 41.91,50.9 41.91,47.09 31.55,36.73 27.43,36.73 22.25,31.55 U$1.40
N$7  (via drill 0.35)
  Top 0.305: v25.15,75.59 26.36,75.59 26.67,75.89 39.47,75.89 41.15,74.22 12__13.2
  Bottom 0.305: v25.15,75.59 24.84,75.89 12.65,75.89 11.58,74.83 11.58,73.76 6.25,68.43 1.83,68.43 REL6.NO2
N$8
  Top 0.305: R5.1 16.76,44.35 20.12,44.35 20.73,43.74 20.73,30.02 19.96,29.26 19.96,19.2 20.57,18.59 22.25,18.59 U$1.17
N$9
  Top 0.305: M7-3.C 62.33,58.22 59.59,58.22 R8.1 59.59,58.37 59.59,60.66 58.37,61.87 58.37,65.53 60.35,67.51 Q9.1
N$10  (via drill 0.35)
  Top 0.305: v3.2,25.45 3.2,26.82 1.98,28.04 1.98,28.8 U$1.3 | v76.96,5.18 76.96,4.88 v78.49,3.35 | R1_B1.2 88.09,2.13 84.89,2.13 R2_T1.1
  Bottom 0.305: v3.2,25.45 3.5,25.45 3.96,24.99 5.03,24.99 6.1,26.06 6.1,26.36 7.01,27.28 9.14,27.28 10.21,26.21 10.21,16.15 11.73,14.63 11.73,13.87 9.75,11.89 9.14,11.89 8.23,10.97 8.23,10.36 14.48,4.12 73.61,4.12 74.68,5.18 v76.96,5.18 | v78.49,3.35 80.16,1.68 84.28,1.68 84.73,2.13 R2_T1.1
N$11  (via drill 0.35)
  Top 0.305: R11.1 59.59,53.34 59.59,56.08 R8.2 59.74,56.08 62.64,56.08 63.86,57.3 63.86,59.44 v62.79,60.5 | v31.24,60.81 v35.05,60.81 | v6.1,35.05 6.1,34.75 3.2,31.85 3.2,27.74 4.57,26.36 U$1.4
  Bottom 0.305: v62.79,60.5 42.22,60.5 41.91,60.81 v35.05,60.81 | v31.24,60.81 17.68,60.81 6.1,49.23 v6.1,35.05
N$12
  Top 0.305: R21.2 72.24,46.18 70.56,46.18 69.8,45.41 2N2222_3.2
N$13
  Top 0.305: M7-2.A 19.05,42.82 13.72,42.82 12.5,44.04 2N2222_5.1 12.34,44.2 11.28,45.26 11.28,47.24 12.04,48.01 12.04,50.44 REL2.COIL_2
N$14
  Top 0.305: R4.2 63.4,46.18 64.16,45.41 64.31,45.41 64.62,45.11 64.62,43.43 63.09,41.91 55.02,41.91 54.1,42.82 54.1,43.43 54.71,44.04 56.08,44.04 2N2222_1.1
N$15
  Top 0.305: R5.2 16.61,46.18 15.09,46.18 14.33,45.41 2N2222_5.2
N$16
  Top 0.889: REL2.COM1 19.66,58.22 19.66,60.96 13.72,66.9 13.72,73.61 13.26,74.07 XX3.2
N$17
  Top 0.305: R9.1 27.13,44.2 30.63,44.2 31.09,43.74 31.09,39.93 29.87,38.71 29.87,34.59 25.3,30.02 24.23,30.02 23.47,29.26 23.47,22.4 24.69,21.18 U$1.18
N$18
  Top 0.305: U$1.21 23.47,19.96 29.26,19.96 35.51,26.21 37.49,26.21 39.47,28.19 39.47,39.01 41.6,41.15 41.6,43.74 41.15,44.2 37.64,44.2 R20.1
N$19
  Top 0.889: REL2.NO1 19.66,68.43 19.66,71.17 16.76,74.07 XX3.1
N$20  (via drill 0.35)
  Top 0.305: v71.02,29.26 70.71,28.96 68.89,28.96 67.51,30.33 67.51,31.39 65.99,32.92 65.99,36.42 R29.1 | v75.44,27.58 75.44,26.82 79.7,22.55 79.7,21.95 80.62,21.03 82.6,21.03 83.52,20.12 v83.52,5.94
  Bottom 0.305: v71.02,29.26 73.76,29.26 v75.44,27.58 | v83.52,5.94 83.52,5.03 82.6,4.12 78.94,4.12 78.79,4.27 74.68,4.27 73.3,2.9 L2-OD1.2
N$21  (via drill 0.35)
  Top 0.305: v70.1,29.87 70.1,31.39 67.67,33.83 67.67,36.88 66.9,37.64 66.75,37.64 65.99,38.41 R29.2 | v68.73,25.91 69.34,25.3 69.34,20.73 66.14,17.53 66.14,12.95 69.19,9.91 v75.29,9.91 | v89.31,10.82 v84.58,10.82 | v96.62,14.17 96.62,24.08 93.57,27.13 +_39.2
  Bottom 0.305: v70.1,29.87 70.1,27.28 v68.73,25.91 | v75.29,9.91 83.67,9.91 v84.58,10.82 | v89.31,10.82 90.83,10.82 90.98,10.67 92.05,10.67 92.96,11.58 94.03,11.58 v96.62,14.17
N$22
  Top 0.305: R25.2 74.98,46.18 74.22,45.41 74.07,45.41 73.61,44.96 73.61,43.43 73.3,43.13 68.58,43.13 67.82,43.89 2N2222_3.1
N$23
  Top 0.305: R26.1 65.23,58.22 67.97,58.22 M7-7.C 68.12,58.37 68.12,61.72 68.43,62.03 68.43,65.53 66.45,67.51 Q12.1
N$24
  Top 0.305: R10.1 6.4,44.35 9.91,44.35 10.36,43.89 10.36,38.1 5.79,33.53 5.79,23.32 4.88,22.4 3.96,22.4 3.2,21.64 3.2,19.96 1.98,18.75 U$1.11
N$25
  Top 0.305: R1_B.2 87.94,16.76 85.04,16.76 R1_T.1
  Bottom 0.305: U$1.2 12.8,28.8 21.64,19.96 33.22,19.96 40.08,13.11 54.41,13.11 57.45,16.15 70.87,16.15 71.48,15.54 83.82,15.54 R1_T.1
N$26
  Top 0.305: REL2.NO2 12.04,68.43 12.04,73.15 11.58,73.61 11.58,74.83 13.26,76.5 42.37,76.5 44.65,74.22 12__13.1
N$27  (via drill 0.35)
  Top 0.305: R41.1 82.6,53.34 v82.6,54.71 82.6,56.08 R40.2 | v97.23,36.12 97.23,14.78 97.54,14.48 97.54,10.67 90.37,3.5 84.28,3.5 83.36,2.59 83.36,2.29 82.75,1.68 21.49,1.68 v8.84,14.33
  Bottom 0.305: v82.6,54.71 82.6,54.25 91.14,45.72 91.14,41.3 93.12,39.32 94.03,39.32 v97.23,36.12 | v8.84,14.33 8.84,17.22 4.88,21.18 U$1.8
N$28  (via drill 0.35)
  Top 0.305: v34.9,41.3 34.9,38.56 R12.2 | v47.4,59.59 47.4,60.66 47.7,60.96 47.7,65.08 v47.4,65.38 | v97.99,66.45 97.99,66.14 98.6,65.53 98.6,49.84 93.57,44.81 +_33.1
  Bottom 0.305: v34.9,41.3 39.17,45.57 39.17,51.36 v47.4,59.59 | v47.4,65.38 52.43,65.38 53.34,66.29 62.48,66.29 65.08,63.7 96.93,63.7 97.99,64.77 v97.99,66.45
N$29
  Top 0.305: R28.2 83.97,46.18 82.3,46.18 81.53,45.41 2N2222_4.2
N$30  (via drill 0.35)
  Top 0.305: v70.56,44.2 72.24,44.2 R21.1 | v65.84,42.67 64.77,42.67 63.4,41.3 54.41,41.3 51.51,44.2 v50.29,44.2 | v17.53,27.89 7.92,18.29 7.92,14.02 10.67,11.28 10.97,11.28 11.58,10.67 11.58,10.06 10.97,9.45 6.86,9.45 3.2,13.11 3.2,14.78 4.42,16 U$1.13
  Bottom 0.305: v70.56,44.2 70.26,44.2 68.73,42.67 v65.84,42.67 | v50.29,44.2 42.22,36.12 27.74,36.12 23.47,31.85 23.47,30.79 22.71,30.02 19.66,30.02 v17.53,27.89
N$31
  Top 0.305: R1.2 58.83,46.18 58.06,45.41 2N2222_1.2
N$32
  Top 0.305: 2N2222_4.1 79.55,44.96 81.99,47.4 84.89,47.4 85.95,46.33 86.72,46.33 R31.2
N$33  (via drill 0.35)
  Top 0.305: v77.42,33.68 77.42,41.45 78.03,42.06 79.86,42.06 81.99,44.2 83.97,44.2 R28.1 | v60.2,17.07 60.2,14.94 v56.54,11.28 | v9.14,10.67 7.47,10.67 4.57,13.56 U$1.14
  Bottom 0.305: v77.42,33.68 77.42,28.19 74.37,25.15 74.37,24.99 73.61,24.23 70.41,24.23 64.77,18.59 61.72,18.59 v60.2,17.07 | v56.54,11.28 9.75,11.28 v9.14,10.67
N$34  (via drill 0.35)
  Top 0.305: 76.81,54.71 76.81,53.34 R37.1 | 76.81,54.71 76.81,56.08 R36.2 | v76.35,54.71 76.81,54.71 | v44.65,55.63 25.76,55.63 21.03,50.9 21.03,45.26 v20.73,44.96 | v11.28,35.51 11.28,28.8 v8.84,26.36
  Bottom 0.305: v76.35,54.71 54.25,54.71 52.43,56.54 45.57,56.54 v44.65,55.63 | v11.28,35.51 v20.73,44.96 | v8.84,26.36 4.88,22.4 3.2,22.4 1.98,23.62 U$1.7
N$35  (via drill 0.35)
  Top 0.305: v55.02,38.25 55.17,38.41 R23.1 | v45.72,31.85 45.72,28.5 49.61,24.61 | 49.61,24.61 53.65,20.57 53.65,18.75 57.15,15.24 v57.76,15.24 | U$1.37 28.35,28.8 32.16,24.99 33.38,24.99 v36.73,28.35 | v49.53,24.38 49.53,24.54 49.61,24.61
  Bottom 0.305: v55.02,38.25 52.58,38.25 48.77,34.44 48.62,34.44 46.02,31.85 v45.72,31.85 | v57.76,15.24 58.06,15.24 58.37,15.54 69.34,15.54 70.71,14.17 70.71,13.72 71.48,12.95 73.91,12.95 75.74,14.78 80.31,14.78 80.77,14.33 L2-OD7.3 | v36.73,28.35 37.34,28.96 41,28.96 43.89,26.06 47.85,26.06 v49.53,24.38
N$36
  Top 0.305: R32.1 71.02,58.22 73.76,58.22 M7-11.C 73.91,58.37 73.91,61.57 74.22,61.87 74.22,65.53 72.24,67.51 Q14.1
N$37  (via drill 0.35)
  Top 0.305: R33.1 71.02,53.34 71.02,56.08 R32.2 70.87,56.08 v67.36,56.08 | v57.91,56.84 57.91,57.15 58.06,57.3 58.06,61.27 56.54,62.79 56.54,63.4 v56.24,63.7 | v7.01,26.06 v7.01,29.72
  Bottom 0.305: v67.36,56.08 58.67,56.08 v57.91,56.84 | v56.24,63.7 52.43,63.7 51.66,64.47 37.49,64.47 31.39,58.37 31.39,49.84 29.41,47.85 11.89,47.85 10.36,46.33 10.36,33.07 v7.01,29.72 | v7.01,26.06 4.57,23.62 U$1.6
N$38
  Top 0.305: 18__1.1 93.42,17.68 86.56,24.54 86.56,36.73 85.04,38.25 85.04,41.3 R1_T1.2
N$39  (via drill 0.35)
  Top 0.305: v57.91,43.43 58.67,44.2 60.81,44.2 R1.1 | v21.95,33.53 v26.36,33.53 | v16.46,28.04 6.55,18.14 v6.55,17.98
  Bottom 0.305: v57.91,43.43 57.15,43.43 54.56,40.84 47.85,40.84 42.52,35.51 28.35,35.51 v26.36,33.53 | v16.46,28.04 v21.95,33.53 | v6.55,17.98 5.64,17.98 5.03,17.37 3.2,17.37 U$1.12
N$40
  Top 0.889: REL5.COM1 30.02,58.06 30.02,60.81 24.08,66.75 24.08,70.26 20.27,74.07 XX6.2
N$41  (via drill 0.35)
  Top 0.305: v35.81,34.59 36.12,34.9 36.12,36.88 36.88,37.64 37.03,37.64 37.8,38.41 R13.1 | v28.65,34.59 26.67,32.61 24.23,32.61 23.47,31.85 23.47,30.79 22.71,30.02 21.64,30.02 21.03,29.41 21.03,24.99 22.25,23.77 U$1.34 22.25,23.62 20.88,22.25 v20.88,19.51 | v61.42,17.07 61.42,14.94 v58.98,12.5
  Bottom 0.305: v28.65,34.59 v35.81,34.59 | v61.42,17.07 62.33,17.98 65.08,17.98 70.71,23.62 73.91,23.62 74.98,24.69 74.98,24.84 80.77,30.63 80.77,31.24 L2-OD2.3 | v58.98,12.5 30.18,12.5 25.3,17.37 21.79,17.37 20.88,18.29 v20.88,19.51
N$42  (via drill 0.35)
  Top 0.305: v32,39.78 31.7,39.47 31.7,38.56 R7.1 | v91.29,11.58 84.73,5.03 83.52,5.03 82.45,3.96 80.31,3.96 78.79,2.44 75.13,2.44 74.37,3.2 74.37,3.35 73.61,4.12 58.83,4.12 v48.92,14.02
  Bottom 0.305: v32,39.78 26.98,39.78 15.54,28.35 15.54,27.74 18.29,24.99 22.71,24.99 23.93,23.77 24.69,23.77 U$1.33 24.84,23.62 30.48,23.62 40.08,14.02 v48.92,14.02 | v91.29,11.58 91.29,30.63 85.04,36.88 80.92,36.88 L2-OD.3
N$43
  Top 0.305: R2_T1.2 86.41,12.34 87.63,13.56 93.12,13.56 93.42,13.26 18__2.2
N$44
  Top 0.305: R36.1 76.81,58.22 79.55,58.22 M7-14.C 79.7,58.37 79.7,61.57 80.16,62.03 80.16,65.53 78.18,67.51 Q16.1
N$45
  Top 0.889: REL5.NO1 30.02,68.28 29.57,68.28 23.77,74.07 XX6.1
N$46  (via drill 0.35)
  Top 0.305: v70.56,37.49 70.03,36.96 | 70.03,36.96 69.65,36.58 69.04,36.58 R30.1 | v90.22,28.19 92.81,25.6 93.73,25.6 95.71,23.62 95.71,9.75 90.37,4.42 84.28,4.42 82.75,2.9 80.92,2.9 L2-OD1.3 | v74.98,36.12 74.07,36.12 73.76,35.81 71.17,35.81 70.03,36.96
  Bottom 0.305: v70.56,37.49 70.26,37.49 70.1,37.34 59.74,37.34 58.37,38.71 56.69,38.71 51.82,33.83 48.92,33.83 45.72,30.63 42.06,30.63 40.69,32 35.2,32 32.77,29.57 26.52,29.57 24.84,31.24 U$1.39 | v90.22,28.19 90.22,30.79 85.19,35.81 75.29,35.81 v74.98,36.12
N$47  (via drill 0.35)
  Top 0.305: v37.34,30.48 34.9,32.92 34.9,36.42 R12.1
  Bottom 0.305: v37.34,30.48 40.39,30.48 43.43,27.43 53.65,27.43 58.37,32.16 63.09,32.16 65.68,29.57 66.75,29.57 67.51,30.33 67.51,31.39 68.28,32.16 72.39,32.16 73.15,31.39 L2-OD2.2
N$48  (via drill 0.51)
  Top 0.889: v34.59,64.01 REL8.COM1
  Bottom 0.889: v34.59,64.01 34.59,68.89 31.39,72.08 29.26,72.08 27.28,74.07 XX8.2
N$49
  Top 0.889: REL8.NO1 40.54,68.28 36.58,68.28 30.79,74.07 XX8.1
N$50  (via drill 0.51)
  Top 0.889: v46.63,67.36 47.09,67.36 48.62,65.84 48.62,63.25 50.9,60.96 50.9,58.06 REL10.COM1
  Bottom 0.889: v46.63,67.36 43.28,70.71 37.64,70.71 34.29,74.07 XX10.2
N$51
  Bottom 0.889: REL10.NO1 50.9,68.28 47.85,68.28 43.89,72.24 39.62,72.24 37.8,74.07 XX10.1
N$52
  Top 0.305: R40.1 82.6,58.22 85.34,58.22 M7-16.C 85.5,58.37 85.5,61.42 85.95,61.87 85.95,65.53 83.97,67.51 Q18.1
N$53
  Top 0.889: REL6.COM1 9.3,58.22 9.3,59.44 6.25,62.48 6.25,74.07 XX1.2
N$54
  Top 0.889: REL6.NO1 9.45,68.43 9.45,73.91 9.6,74.07 XX1.1
N$55  (via drill 0.35)
  Top 0.305: v42.52,41.15 41,39.62 41,38.56 R14.2
  Bottom 0.305: v42.52,41.15 42.52,46.94 48.46,52.88 79.55,52.88 82.91,56.24 86.41,56.24 91.75,50.9 91.75,42.98 93.42,41.3 +_35.2
N$56  (via drill 0.35)
  Top 0.305: v48.77,38.41 50.29,38.41 R19.1 | v42.52,31.55 42.52,29.41 42.44,29.34 | 42.44,29.34 35.97,22.86 v34.29,22.86 | v75.44,3.35 75.44,4.88 77.42,6.86 77.42,12.19 77.11,12.5 77.11,14.63 80.77,18.29 80.77,19.81 L2-OD5.3 | v58.52,3.2 48.01,13.72 48.01,23.77 42.44,29.34
  Bottom 0.305: v48.77,38.41 42.52,32.16 v42.52,31.55 | v34.29,22.86 32.16,22.86 30.02,24.99 23.62,24.99 22.25,26.36 U$1.36 | v75.44,3.35 73.76,1.68 60.05,1.68 v58.52,3.2
N$57
  Top 0.305: R1_T.2 85.04,26.82 85.04,25.15 91.75,18.44 91.75,16.15 92.96,14.94 94.03,14.94 95.1,13.87 95.1,11.43 93.57,9.91 18__2.1
N$58  (via drill 0.35)
  Top 0.305: v41.3,34.59 41,34.9 41,36.42 R14.1 | v46.63,33.68 46.63,28.5 54.25,20.88 54.25,19.05 54.71,18.59 v57.76,18.59
  Bottom 0.305: v41.3,34.59 43.74,34.59 48.46,39.32 49.07,39.32 49.68,38.71 49.68,38.1 47.85,36.27 47.7,36.27 46.63,35.2 v46.63,33.68 | v57.76,18.59 60.81,18.59 65.68,23.47 68.73,23.47 70.71,25.45 73.15,25.45 L2-OD3.2
N$60  (via drill 0.35)
  Top 0.305: v46.63,41.76 47.09,41.3 47.09,38.56 R18.2 | v55.63,48.92 57.61,48.92 v58.52,48.01
  Bottom 0.305: v46.63,41.76 52.58,47.7 54.41,47.7 v55.63,48.92 | v58.52,48.01 80.31,48.01 86.56,41.76 86.56,41 89.76,37.8 93.42,37.8 +_35.1
N$61  (via drill 0.35)
  Top 0.305: 42.6,32.84 40.08,30.33 40.08,27.89 36.42,24.23 v35.97,24.23 | 42.6,32.84 45.41,35.66 45.41,37.34 45.11,37.64 44.96,37.64 44.2,38.41 R15.1 | v74.68,19.66 73,17.98 71.48,17.98 68.58,15.09 v68.58,13.56 | v57.15,14.33 48.62,22.86 48.62,24.69 43.43,29.87 43.43,32 42.6,32.84
  Bottom 0.305: v35.97,24.23 35.66,24.23 33.07,26.82 25.3,26.82 24.84,26.36 U$1.35 | v74.68,19.66 75.59,20.57 75.59,24.54 80.31,29.26 82.6,29.26 83.36,28.5 83.36,27.58 81.38,25.6 80.92,25.6 L2-OD3.3 | v68.58,13.56 57.91,13.56 v57.15,14.33
N$62  (via drill 0.35)
  Top 0.305: M7-6.A 8.84,42.82 v7.01,42.82 3.35,42.82 2.13,44.04 2N2222_6.1 | v4.27,48.01 6.71,48.01 v7.01,47.7
  Bottom 0.305: v4.27,48.01 1.83,50.44 REL6.COIL_2 | v7.01,42.82 v7.01,47.7
N$65  (via drill 0.35)
  Top 0.305: v54.86,39.32 54.1,38.56 53.49,38.56 R22.2
  Bottom 0.305: v54.86,39.32 58.98,39.32 60.35,37.95 69.8,37.95 70.26,38.41 71.32,38.41 71.63,38.1 85.5,38.1 89.31,34.29 93.42,34.29 +_37.2
N$67
  Top 0.305: R45.1 88.39,58.22 91.14,58.22 M7-18.C 91.29,58.37 91.29,61.42 91.9,62.03 91.9,65.53 89.92,67.51 Q20.1
N$69  (via drill 0.35)
  Top 0.305: v61.42,39.47 61.42,38.1 60.5,37.19 60.35,37.19 59.74,36.58 R16.1 | v78.33,41.15 78.33,28.96 80.47,26.82 82.6,26.82 84.43,24.99 84.43,24.54 v89.31,19.66
  Bottom 0.305: v61.42,39.47 69.34,39.47 71.17,41.3 78.18,41.3 v78.33,41.15 | v89.31,19.66 89.31,15.24 86.26,12.19 86.26,11.28 83.52,8.53 80.92,8.53 L2-OD4.2
N$71  (via drill 0.35)
  Top 0.305: v59.74,39.78 59.74,38.56 R16.2
  Bottom 0.305: v59.74,39.78 60.96,38.56 69.34,38.56 71.48,40.69 77.57,40.69 78.03,40.23 80.01,40.23 80.47,40.69 83.82,40.69 88.7,35.81 94.03,35.81 95.1,34.75 95.1,32.31 93.57,30.79 +_37.1
N$72  (via drill 0.35)
  Top 0.305: v58.06,37.8 58.06,39.32 59.44,40.69 61.42,40.69 62.64,39.47 62.64,38.56 R17.1 | v49.99,14.17 58.37,5.79 67.97,5.79 70.56,8.38 73.15,8.38 L2-OD4.3
  Bottom 0.305: v58.06,37.8 56.69,37.8 52.12,33.22 49.23,33.22 46.02,30.02 41.76,30.02 40.39,31.39 35.51,31.39 33.3,29.18 | 33.3,29.18 31.7,27.58 23.47,27.58 U$1.38 | v49.99,14.17 49.07,15.09 46.18,15.09 36.88,24.38 36.88,25.6 33.3,29.18
N$73  (via drill 0.35)
  Top 0.305: R47.1 88.39,53.34 88.39,56.08 R45.2 88.54,56.08 v89.92,56.08 | v65.23,60.96 63.86,62.33 63.86,74.83 61.57,77.11 10.36,77.11 7.92,74.68 v7.92,62.48 | v6.71,33.22 6.71,31.24 7.92,30.02 7.92,20.88 v5.94,18.9
  Bottom 0.305: v89.92,56.08 88.39,56.08 83.52,60.96 v65.23,60.96 | v7.92,62.48 7.92,51.97 5.18,49.23 5.18,34.75 v6.71,33.22 | v5.94,18.9 4.88,19.96 3.2,19.96 1.98,21.18 U$1.9
N$74
  Top 0.305: R18.1 47.24,36.42 47.55,36.42 49.53,34.44 49.53,31.7 51.05,30.18 55.63,30.18 58.98,26.82 69.04,26.82 72.24,23.62 73.61,23.62 74.37,22.86 74.37,21.03 73.3,19.96 L2-OD5.2
N$76
  Top 0.305: M7-5.A 29.57,42.82 23.93,42.82 22.86,43.89 2N2222_11.1 22.71,44.04 21.64,45.11 21.64,47.09 22.4,47.85 22.4,50.44 REL5.COIL_2
N$77
  Top 0.305: R9.2 26.98,46.18 25.6,46.18 24.84,45.41 2N2222_11.2
N$78
  Top 0.305: M7-12.C 56.54,58.22 53.8,58.22 R43.1 53.8,58.37 53.8,60.66 52.58,61.87 52.58,65.53 Q10.1
N$81
  Bottom 0.305: REL5.NO2 22.55,68.28 22.55,70.71 25.6,73.76 25.6,74.83 26.67,75.89 46.48,75.89 48.16,74.22 12__1.2
N$84  (via drill 0.35)
  Top 0.305: v51.97,32.31 53.34,33.68 53.34,36.42 R22.1 | v51.97,28.35 51.97,25.91 58.67,19.2 v58.67,14.63 | v69.49,14.17 73.15,14.17 L2-OD7.2
  Bottom 0.305: v51.97,28.35 v51.97,32.31 | v58.67,14.63 69.04,14.63 v69.49,14.17
N$85
  Top 0.305: R50.1 94.18,58.22 96.93,58.22 M7-20.C 97.08,58.37 97.08,61.27 97.69,61.87 97.69,65.53 95.71,67.51 Q22.1
N$86  (via drill 0.35)
  Top 0.305: R51.1 94.18,53.34 v94.18,54.71 94.18,56.08 R50.2 | v95.1,39.47 95.1,37.19 93.73,35.81 92.81,35.81 89.31,32.31 v89.31,30.02 | v10.67,10.36 5.79,15.24 5.79,17.37 4.57,18.59 U$1.10
  Bottom 0.305: v94.18,54.71 94.18,49.68 95.1,48.77 v95.1,39.47 | v89.31,30.02 86.26,26.98 86.26,26.36 85.04,25.15 84.12,25.15 83.06,24.08 83.06,23.16 86.26,19.96 86.26,16.15 82.75,12.65 76.05,12.65 74.37,10.97 74.37,10.52 73.76,9.91 45.57,9.91 45.11,10.36 v10.67,10.36
N$87
  Top 0.305: REL8.NO2 33.07,68.12 35.36,68.12 36.58,66.9 41.15,66.9 42.06,67.82 42.06,68.73 45.87,72.54 50.14,72.54 51.66,74.07 12__1.1
N$91
  Top 0.305: REL10.NO2 43.43,68.28 49.23,68.28 55.17,74.22 12__2.2
N$92
  Top 0.305: M7-8.A 39.93,42.82 34.44,42.82 33.38,43.89 2N2222_14.1 33.22,44.04 32,45.26 32,46.94 32.92,47.85 REL8.COIL_2
N$93
  Top 0.305: R20.2 35.97,46.18 35.2,45.41 2N2222_14.2
N$96
  Top 0.889: Q10.2 54.56,65.08 55.17,65.08 58.22,68.12 58.22,73.61 58.67,74.07 12__2.1
N$97  (via drill 0.35)
  Top 0.305: v26.82,49.07 30.79,53.03 51.05,53.03 v52.12,51.97 | R1_T1.1 84.89,31.24 84.89,37.49 83.67,38.71 83.67,41.91 84.43,42.67 86.72,42.67 87.94,41.45 R1_B2.2
  Bottom 0.305: v26.82,49.07 12.19,49.07 9.75,46.63 9.75,35.05 6.1,31.39 4.57,31.39 U$1.1 | v52.12,51.97 83.97,51.97 87.94,48.01 R1_B2.2
N$100
  Top 0.889: Q9.2 60.5,65.08 60.96,65.08 62.79,66.9 62.79,73.61 62.33,74.07 12__3.2
N$101
  Bottom 0.889: Q12.2 66.29,65.08 65.84,65.08 64.01,66.9 64.01,72.39 65.68,74.07 12__3.1
N$102
  Top 0.889: Q14.2 72.08,65.08 71.63,65.08 69.34,67.36 69.34,74.07 12__4.2
N$103
  Top 0.305: M7-10.A 50.44,42.67 44.96,42.67 43.74,43.89 2N2222_16.1 43.59,44.04 42.52,45.11 42.52,46.94 43.28,47.7 43.28,50.44 REL10.COIL_2
N$104
  Top 0.305: R24.2 48.01,46.18 46.48,46.18 45.72,45.41 2N2222_16.2
N$107
  Bottom 0.889: Q16.2 78.03,65.08 77.57,65.08 72.85,69.8 72.85,74.07 12__4.1
N$108
  Top 0.889: Q18.2 83.82,65.08 83.36,65.08 80.31,68.12 80.31,70.1 76.35,74.07 12__5.2
N$109
  Top 0.889: Q20.2 89.76,65.08 89.31,65.08 80.31,74.07 79.86,74.07 12__5.1
N$110
  Top 0.889: Q22.2 95.56,65.08 95.1,65.08 92.05,68.12 92.05,68.28 88.09,72.24 85.19,72.24 83.36,74.07 12__6.2
N$111  (via drill 0.35)
  Top 0.305: v55.02,43.13 55.63,42.52 61.11,42.52 62.79,44.2 63.25,44.2 R4.1 | v85.8,48.92 87.02,48.92 v88.09,49.99 | v86.11,55.32 86.11,56.39 87.02,57.3 v87.02,65.68
  Bottom 0.305: v55.02,43.13 55.02,47.09 56.84,48.92 v85.8,48.92 | v88.09,49.99 88.09,53.34 v86.11,55.32 | v87.02,65.68 87.02,73.76 86.72,74.07 12__6.1
N$112
  Top 0.305: R25.1 75.13,44.35 75.74,44.96 75.89,44.96 76.35,45.41 76.35,49.68 75.44,50.6 75.44,72.69 74.52,73.61 74.52,74.83 75.59,75.89 88.39,75.89 90.07,74.22 12__7.2
N$113  (via drill 0.35)
  Top 0.305: v92.81,65.68 92.81,50.14 87.63,44.96 87.48,44.96 86.87,44.35 R31.1
  Bottom 0.305: v92.81,65.68 92.81,73.3 93.57,74.07 12__7.1
VCC  (via drill 0.51)
  Top 0.635: L2-OD3.4 80.77,28.19 79.55,29.41 79.55,31.85 80.77,33.07 80.77,33.68 L2-OD2.4 80.62,33.98 79.55,35.05 79.55,37.49 80.77,38.71 80.77,39.47 L2-OD.4 | L2-OD7.4 80.77,16.61 v78.03,13.87 78.03,13.56 78.33,13.26 78.33,9.14 80.77,6.71 80.77,5.33 L2-OD1.4 | C6.+ 11.43,19.96 10.52,19.05 10.52,14.33 C5.2 10.82,14.33 13.26,14.33 15.54,12.04 30.79,12.04 38.56,19.81 v38.86,19.81 42.22,19.81 44.04,21.64 44.04,22.4 IC1.2 | v32.61,25.91 29.72,28.8 29.72,30.79 C3.+ | v62.94,17.07 58.22,21.79 57.3,21.79 56.39,22.71 56.39,23.62 57.3,24.54 63.09,24.54 C1.2
  Bottom 0.635: L2-OD3.4 80.77,28.04 79.55,26.82 79.55,24.99 80.77,23.77 80.77,22.55 L2-OD5.4 80.77,22.1 80.77,21.64 79.55,20.42 79.55,18.29 | v78.03,13.87 76.05,13.87 73.3,11.12 L2-OD4.4 | 79.55,18.29 79.55,17.98 80.77,16.76 L2-OD7.4 | U$1.3V3 2.44,13.56 3.96,12.04 8.08,12.04 10.36,14.33 C5.2 | C1.2 63.09,24.54 60.96,24.54 57.3,20.88 48.31,20.88 47.24,19.81 46.02,19.81 44.2,21.64 44.2,22.4 IC1.2 | v32.61,25.91 34.59,23.93 34.75,23.93 v38.86,19.81 | 79.55,18.29 66.6,18.29 65.38,17.07 v62.94,17.07

### Text on the board
tValues: BOREH | POOL P | PLUGS | TANK F | POOL L | BH PP | PL TF | PL TF | TS V1 | V2 V3 | V4 V5 | V6 SDE | TL TH | TF | SDE | PF | PL | PLU | FH | FL | +5V | GND | SI1 | SI2 | SI3 | ESP32-S2 WATER CONT - 06/05/2024 V5 | 12V | - | +